# EasyEDA Pro project Zuko.epro, schematic Firebending
Assembly Variant: Basic; Board Name: Zuko V1; Create Date: 2026-10-25; Page Name: P1; Project Name: Zuko; Schematic Name: Firebending; Update Date: 2026-10-25; Company: 嘉立创EDA; Page Size: A4; Version: V1.0
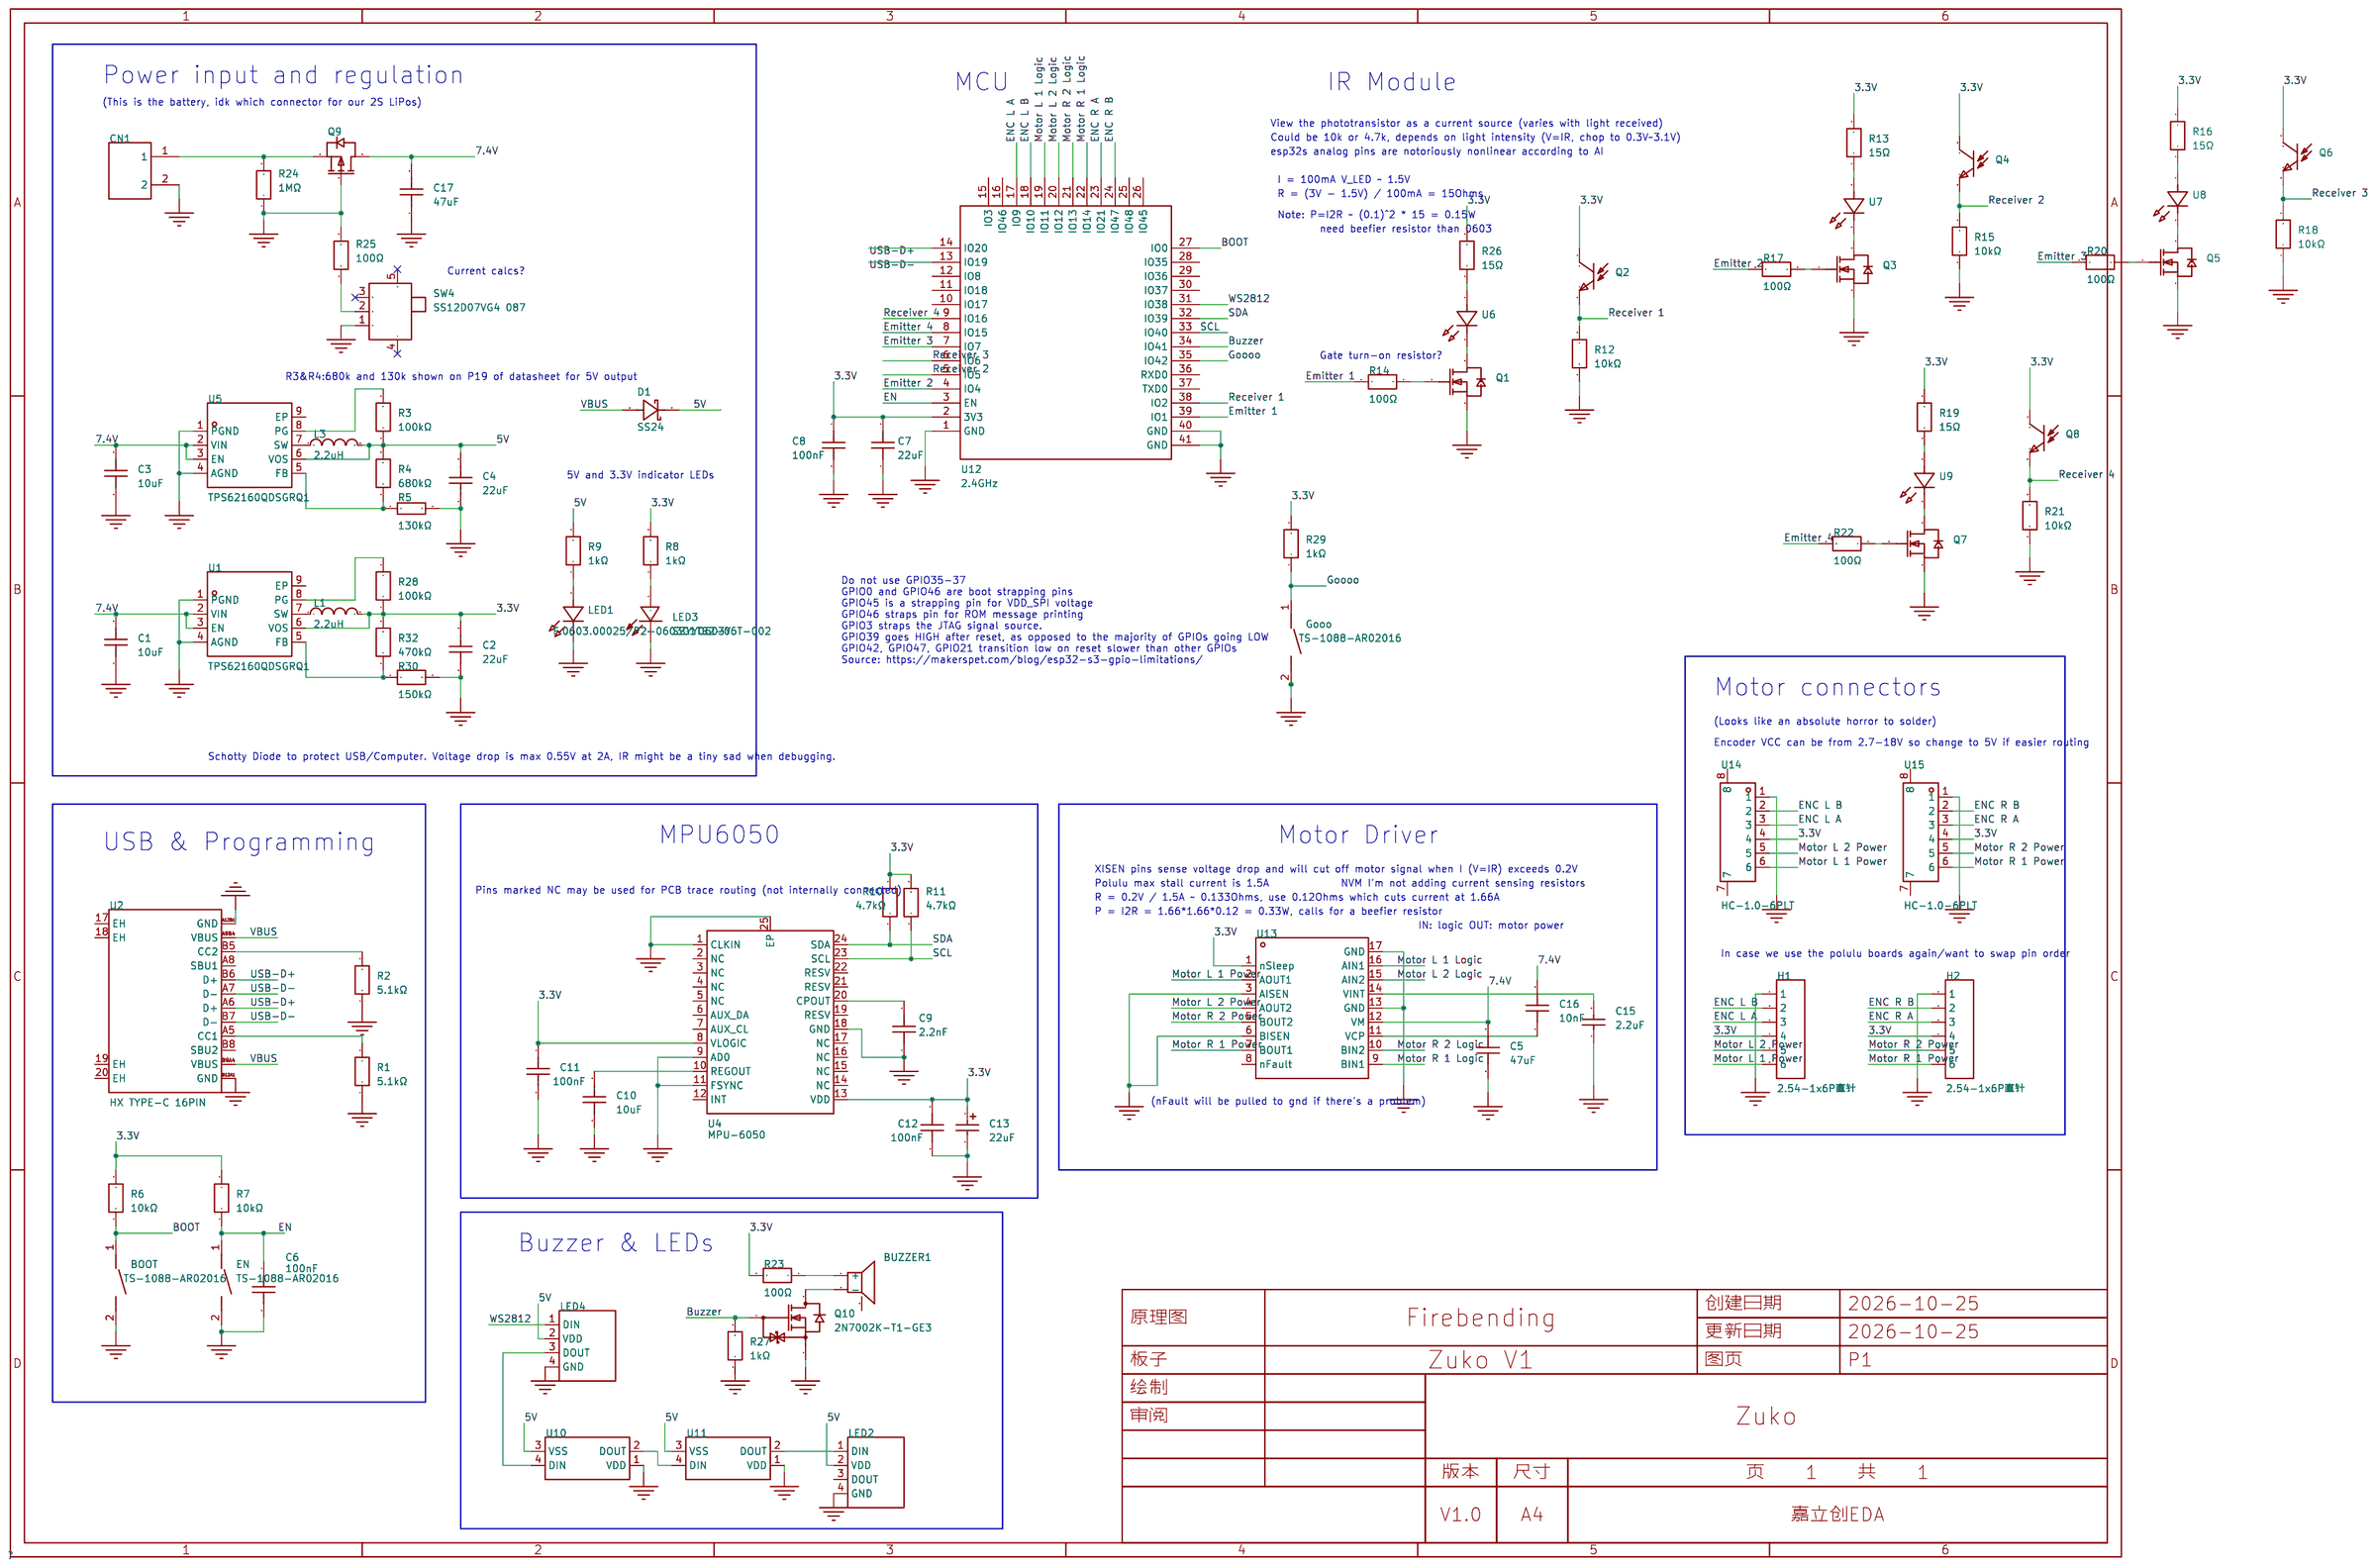
[diagram p0: schematic sheet]

## Parts
BOOT  TS-1088-AR02016  [SW-SMD_L3.9-W3.0-P4.45]
BUZZER1  4kHz  [BUZ-SMD_L5.0-W5.5-P4.60]
C1  10uF  [C0603]
C2  22uF  [C0603]
C3  10uF  [C0603]
C4  22uF  [C0603]
C5  47uF  [C1206]
C6  100nF  [C0603]
C7  22uF  [C0603]
C8  100nF  [C0603]
C9  2.2nF  [C0603]
C10  10uF  [C0603]
C11  100nF  [C0603]
C12  100nF  [C0603]
C13  22uF  [CASE-A_3216]
C15  2.2uF  [C0603]
C16  10nF  [C0603]
C17  47uF  [C1206]
CN1  B2B-PH-K-S(LF)(SN)  [CONN-TH_B2B-PH-K-S]
D1  SS24  [SMA_L4.3-W2.6-LS5.0-FD]
EN  TS-1088-AR02016  [SW-SMD_L3.9-W3.0-P4.45]
Gooo  TS-1088-AR02016  [SW-SMD_L3.9-W3.0-P4.45]
H1  2.54-1x6P直针  [HDR-TH_6P-P2.54-V-M-1]
H2  2.54-1x6P直针  [HDR-TH_6P-P2.54-V-M-1]
L1  2.2uH  [IND-SMD_L2.0-W1.6_WPN2016X]
L3  2.2uH  [IND-SMD_L2.0-W1.6_WPN2016X]
LED1  F.0603.00025/P2-0603G1TS2-06T-002  [LED0603-RD_GREEN]
LED2  WS2812C-4020-H2  [LED-SMD_4P-L4.0-W1.7_DCS-CA4020A0R02G02B02CE004]
LED3  SZYY0603Y  [LED0603-R-RD_YELLOW]
LED4  WS2812C-4020-H2  [LED-SMD_4P-L4.0-W1.7_DCS-CA4020A0R02G02B02CE004]
Q1  BS170FTA  [SOT-23-3_L2.9-W1.3-P1.90-LS2.4-BR]
Q2  TEFT4300  [SENSOR-TH_TEFT4300]
Q3  BS170FTA  [SOT-23-3_L2.9-W1.3-P1.90-LS2.4-BR]
Q4  TEFT4300  [SENSOR-TH_TEFT4300]
Q5  BS170FTA  [SOT-23-3_L2.9-W1.3-P1.90-LS2.4-BR]
Q6  TEFT4300  [SENSOR-TH_TEFT4300]
Q7  BS170FTA  [SOT-23-3_L2.9-W1.3-P1.90-LS2.4-BR]
Q8  TEFT4300  [SENSOR-TH_TEFT4300]
Q9  FQP27P06(UMW)  [TO-220-3_L10.0-W4.5-P2.54-L]
Q10  2N7002K-T1-GE3  [SOT-23-3_L2.9-W1.6-P1.90-LS2.8-BR]
R1  5.1kΩ  [R0603]
R2  5.1kΩ  [R0603]
R3  100kΩ  [R0603]
R4  680kΩ  [R0603]
R5  130kΩ  [R0603]
R6  10kΩ  [R0603]
R7  10kΩ  [R0603]
R8  1kΩ  [R0603]
R9  1kΩ  [R0603]
R10  4.7kΩ  [R0603]
R11  4.7kΩ  [R0603]
R12  10kΩ  [R0603]
R13  15Ω  [R0805]
R14  100Ω  [R0603]
R15  10kΩ  [R0603]
R16  15Ω  [R0805]
R17  100Ω  [R0603]
R18  10kΩ  [R0603]
R19  15Ω  [R0805]
R20  100Ω  [R0603]
R21  10kΩ  [R0603]
R22  100Ω  [R0603]
R23  100Ω  [R0603]
R24  1MΩ  [R0603]
R25  100Ω  [R0603]
R26  15Ω  [R0805]
R27  1kΩ  [R0603]
R28  100kΩ  [R0603]
R29  1kΩ  [R0603]
R30  150kΩ  [R0603]
R32  470kΩ  [R0603]
SW4  SS12D07VG4 087  [SW-TH_SS12D07VG4]
U1  TPS62160QDSGRQ1  [WSON-8_L2.0-W2.0-P0.50-TL-EP]
U2  HX TYPE-C 16PIN  [TYPE-C-SMD_HX-TYPE-C-16PIN]
U4  MPU-6050  [QFN-24_L4.0-W4.0-P0.50-BL-EP2.7]
U5  TPS62160QDSGRQ1  [WSON-8_L2.0-W2.0-P0.50-TL-EP]
U6  SFH 4545-DWEW  [LED-TH_BD5.6-P2.54-FD]
U7  SFH 4545-DWEW  [LED-TH_BD5.6-P2.54-FD]
U8  SFH 4545-DWEW  [LED-TH_BD5.6-P2.54-FD]
U9  SFH 4545-DWEW  [LED-TH_BD5.6-P2.54-FD]
U10  WS2812  [LED-SMD_4P-L5.0-W5.0-TL-A]
U11  WS2812  [LED-SMD_4P-L5.0-W5.0-TL-A]
U12  2.4GHz  [WIRELM-SMD_ESP32-S3-WROOM-1U]
U13  DRV8833PWPR  [TSSOP-16_L5.0-W4.4-P0.65-LS6.4-BL-EP]
U14  HC-1.0-6PLT  [CONN-SMD_6P-P1.00_HCTL_HC-1.0-6PLT]
U15  HC-1.0-6PLT  [CONN-SMD_6P-P1.00_HCTL_HC-1.0-6PLT]

## Library data of the parts
BOOT EN Gooo = TS-1088-AR02016: 电路结构:单刀单掷;按钮形状:圆形按钮;作用力:1.6N;安装方式:立贴;开关长度:3.9mm;开关宽度:3mm;开关高度:2mm;带支架:不带支架;触点电流:50mA;额定电压:12V;带灯:-;工作寿命:10万次;; LCSC Part Name: 3.9*3*2mm 立贴 轻触开关; Supplier Part: C720477; Manufacturer: XUNPU(讯普); Supplier Footprint: SMD,4x3mm; JLCPCB Part Class: Basic Part; Datasheet: https://item.szlcsc.com/datasheet/TS-1088-AR02016/763484.html; Supplier: LCSC; Circuit: 单刀单掷; Actuator Style: 圆形按钮; Operating Force: 1.6N; Mounting Type: 立贴; Length: 3.9mm; Width: 3mm; Switch Height: 2mm; with Bracket: 不带支架; Contact Current: 50mA; Voltage Rating: 12V; Actuator/Cap Color: 黑色; Termination Style: SMD接片; Life: 10万次; Operating Temperature: -30℃~+80℃
BUZZER1 = MLT-5020: 驱动方式:无源(外部驱动);构造类型:电磁式;额定电压:3V;频率:4kHz;声压(SPL):75dB;; LCSC Part Name: 无源(外部驱动) 电磁式 4kHz; Supplier Part: C94598; Manufacturer: 华能; Supplier Footprint: SMD,5x5mm; JLCPCB Part Class: Extended Part; Datasheet: https://item.szlcsc.com/datasheet/MLT-5020/95796.html; Supplier: LCSC; Driver Circuitry: 无源(外部驱动); Technology: 电磁式; Voltage Rating: 3V; Voltage - Supply: 2V~4V; Current Consumption: 100mA; Sound Pressure Level(SPL): 75dB; Length: 5.2mm; Width: 5.2mm; Height: 2.5mm; Operating Temperature: -20℃~+70℃
C1 C3 C10 = HGC0603R5106M160NTHJ: 容值:10uF;精度:±20%;额定电压:16V;温度系数:X5R;; LCSC Part Name: 10uF ±20% 16V; Supplier Part: C7472959; Manufacturer: Chinocera(华瓷); Supplier Footprint: 0603; JLCPCB Part Class: Extended Part; Datasheet: https://item.szlcsc.com/datasheet/HGC0603R5106M160NTHJ/8532806.html; Supplier: LCSC; Tolerance: ±20%; Voltage Rating: 16V; Temperature Coefficient: X5R
C2 C4 C7 = HGC0603R5226M100NTHJ: 容值:22uF;精度:±20%;额定电压:10V;温度系数:X5R;; LCSC Part Name: 22uF ±20% 10V; Supplier Part: C7432770; Manufacturer: Chinocera(华瓷); Supplier Footprint: 0603; JLCPCB Part Class: Extended Part; Datasheet: https://item.szlcsc.com/datasheet/HGC0603R5226M100NTHJ/8438252.html; Supplier: LCSC; Tolerance: ±20%; Voltage Rating: 10V; Temperature Coefficient: X5R
C5 C17 = HGC1206R5476M250NSPJ: 容值:47uF;精度:±20%;额定电压:25V;温度系数:X5R;; LCSC Part Name: 47uF ±20% 25V; Supplier Part: C22367835; Manufacturer: Chinocera(华瓷); Supplier Footprint: 1206; JLCPCB Part Class: Extended Part; Datasheet: https://item.szlcsc.com/datasheet/HGC1206R5476M250NSPJ/23841140.html; Supplier: LCSC; Tolerance: ±20%; Voltage Rating: 25V; Temperature Coefficient: X5R
C6 C8 C11 C12 = CL10B104KB8WPNC: 容值:100nF;精度:±10%;额定电压:50V;温度系数:X7R;; LCSC Part Name: 100nF ±10% 50V; Supplier Part: C307348; Manufacturer: SAMSUNG(三星); Supplier Footprint: 0603; JLCPCB Part Class: Extended Part; Datasheet: https://item.szlcsc.com/datasheet/CL10B104KB8WPNC/291022.html; Supplier: LCSC; Tolerance: ±10%; Voltage Rating: 50V; Temperature Coefficient: X7R
C9 = FCC0603B222K500CT: 容值:2.2nF;精度:±10%;额定电压:50V;温度系数:X7R;; LCSC Part Name: 2.2nF ±10% 50V; Supplier Part: C5137562; Manufacturer: FOJAN(富捷); Supplier Footprint: 0603; JLCPCB Part Class: Extended Part; Datasheet: https://item.szlcsc.com/datasheet/FCC0603B222K500CT/5747014.html; Supplier: LCSC; Tolerance: ±10%; Voltage Rating: 50V; Temperature Coefficient: X7R
C13 = TAJA226K010RNJ: 容值:22uF;精度:±10%;额定电压:10V;等效串联电阻(ESR):3Ω@100kHz;; LCSC Part Name: 22uF ±10% 10V; Supplier Part: C11366; Manufacturer: Kyocera AVX; Supplier Footprint: CASE-A-3216-18(mm); JLCPCB Part Class: Extended Part; Supplier: LCSC; Tolerance: ±10%; Voltage Rating: 10V; Equivalent Series Resistance(ESR): 3Ω@100kHz; Operating Temperature: -55℃~+125℃
C15 = CL10A225KO8NNNC: 容值:2.2uF;精度:±10%;额定电压:16V;温度系数:X5R;; LCSC Part Name: 2.2uF ±10% 16V; Supplier Part: C23630; Manufacturer: SAMSUNG(三星); Supplier Footprint: 0603; JLCPCB Part Class: Basic Part; Datasheet: https://item.szlcsc.com/datasheet/CL10A225KO8NNNC/24366.html; Supplier: LCSC; Tolerance: ±10%; Voltage Rating: 16V; Temperature Coefficient: X5R
C16 = FCC0603B103K500CT: 容值:10nF;精度:±10%;额定电压:50V;温度系数:X7R;; LCSC Part Name: 10nF ±10% 50V; Supplier Part: C5137477; Manufacturer: FOJAN(富捷); Supplier Footprint: 0603; JLCPCB Part Class: Extended Part; Datasheet: https://item.szlcsc.com/datasheet/FCC0603B103K500CT/5746979.html; Supplier: LCSC; Tolerance: ±10%; Voltage Rating: 50V; Temperature Coefficient: X7R
CN1 = B2B-PH-K-S(LF)(SN): 插针结构:1x2P;间距:2mm;安装方式:直插;参考系列:PH;总PIN数:2P;排数:1;每排PIN数:2;行距:-;额定电流:2A;触头材质:黄铜;触头镀层:锡;工作温度:-25℃~+85℃;; LCSC Part Name: 1x2P 间距:2mm 直插 系列:PH; Supplier Part: C131337; Manufacturer: JST; Supplier Footprint: 插件,P=2mm; JLCPCB Part Class: Extended Part; Datasheet: https://item.szlcsc.com/datasheet/B2B-PH-K-S(LF)(SN)/142630.html; Supplier: LCSC; Pins Structure: 1x2P; Pitch: 2mm; Mounting Type: 直插; Reference Series: PH; Number of Pins: 2P; Number of Rows: 1; Number of PINs Per Row: 2; Current Rating: 2A; Contact Material: 黄铜; Contact Plating: 锡; Operating Temperature: -25℃~+85℃; Voltage Rating: 100V; Plastic Material: PA66; Flame Retardant Rating: UL94V-0; Supplementary Features: 打K脚; Color: 白色; Z-Height of the Board: 6mm; X-Length of Bottom Edge on Board (Spacing Line): 5.9mm; Y-Width of Bottom Edge on Board: 4.5mm
D1 = SS24_C7420362: 二极管配置:独立式;正向压降(Vf):550mV@2A;直流反向耐压(Vr):40V;整流电流:2A;; LCSC Part Name: 电压:40V 电流:2A; Supplier Part: C7420362; Manufacturer: R+O(宏嘉诚); Supplier Footprint: SMA(DO-214AC); JLCPCB Part Class: Extended Part; Datasheet: https://item.szlcsc.com/datasheet/SS24/8397184.html; Supplier: LCSC; Diode Configuration: 独立式; Voltage - Forward(Vf@If): 550mV@2A; Voltage - DC Reverse(Vr): 40V; Current - Rectified: 2A; Reverse Leakage Current (Ir): 200uA@40V; Operating Junction Temperature Range: -55℃~+150℃; Non-Repetitive Peak Forward Surge Current: 50A
H1 H2 = 2.54-1x6P直针: 插针结构:1x6P;间距:2.54mm;行距:-;圆针/方针:方针;安装方式:直插;排数:单排;总PIN位数:6P;额定电流:3A;额定电压:-;配合针长度:6mm;塑高:2.5mm;端接针长度:3mm;触头材质:黄铜;触头镀层:金;工作温度:-40℃~+105℃;颜色:黑色;; LCSC Part Name: 1x6P 间距:2.54mm 方针 直插; Supplier Part: C37208; Manufacturer: BOOMELE(博穆精密); Supplier Footprint: 插件,P=2.54mm; JLCPCB Part Class: Extended Part; Datasheet: https://item.szlcsc.com/datasheet/2.54-1x6P%25E7%259B%25B4%25E9%2592%2588/38187.html; Supplier: LCSC; Pin Structure: 1x6P; Pitch: 2.54mm; Circluar Pins/Square Pins: 方针; Mounting Type: 直插; Number of Rows: 单排; Number of Pins: 6P; Current Rating: 3A; Length of Mating Pin: 6mm; Insulation Height: 2.5mm; Length of End Connection Pin: 3mm; Contact Material: 黄铜; Contact Plating: 金; Operating Temperature: -40℃~+105℃; Color: 黑色
L1 L3 = WPN201612H2R2MT: 电感值:2.2uH;精度:±20%;额定电流:1.8A;饱和电流(Isat):1.7A;类型:磁胶屏蔽电感;; LCSC Part Name: 2.2uH ±20% 1.7A; Supplier Part: C97025; Manufacturer: Sunlord(顺络); Supplier Footprint: 0806; JLCPCB Part Class: Extended Part; Datasheet: https://item.szlcsc.com/datasheet/WPN201612H2R2MT/98230.html; Supplier: LCSC; Tolerance: ±20%; Current Rating: 1.8A; Current - Saturation(Isat): 1.7A; DC Resistance(DCR): 146mΩ; Type: 磁胶屏蔽电感
LED1 = F.0603.00025/P2-0603G1TS2-06T-002: 灯头类型:1.6mmx0.8mm方形灯头;发光颜色:翠绿色;正向压降(Vf):2.6V~2.9V;功率:90mW;正向电流:30mA;波长:520nm~525nm;二极管配置:独立二极管;透镜颜色:-;色温:-;发光强度:230mcd;发光角度:120°;载带方式:-;工作温度:-40℃~+85℃;; LCSC Part Name: 0603翠绿; Supplier Part: C7496818; Manufacturer: TUOZHAN(拓展光电); Supplier Footprint: 0603; JLCPCB Part Class: Extended Part; Datasheet: https://item.szlcsc.com/datasheet/F.0603.00025%252FP2-0603G1TS2-06T-002/8563182.html; Supplier: LCSC; Lamp Holder Type: 1.6mmx0.8mm方形灯头; Illumination Color: 翠绿色; Voltage - Forward(Vf): 2.6V~2.9V; Power(Watts): 90mW; Forward Current: 30mA; Wavelength - Dominant: 520nm~525nm; Peak Wavelength: 517nm; Diode Configuration: 独立二极管; Luminous Intensity: 230mcd; Viewing Angle: 120°; Operating Temperature: -40℃~+85℃
LED2 LED4 = WS2812C-4020-H2: 5V 4020 RGB三色侧发光内置IC幻彩贴片灯珠，小电流，5mA，适用差异化产品，鼠标，键盘，音箱，机箱风扇，电子琴，乐器等; LCSC Part Name: 智能外控集成LED光源; Supplier Part: C42417604; Manufacturer: worldsemi; Supplier Footprint: SMD4020; JLCPCB Part Class: Extended Part; Datasheet: https://item.szlcsc.com/datasheet/WS2812C-4020-H2/44423164.html; Supplier: LCSC; Wavelength: G:525nm~530nm；B:467nm~472nm；R:622nm~626nm; Luminous Intensity: R:180mcd；G:500mcd；B:120mcd; Data Transmission Rate: 800Kbit/s; Voltage - Supply: 3.7V~5.3V; Quiescent Current: 0.6mA; Installation method: 正贴; Operating Temperature: -40℃~+65℃; Length: 4mm; Width: 2mm; Height: 1.65mm; Features: 内置上电复位电路；内置掉电复位电路
LED3 = SZYY0603Y: 灯头类型:-;发光颜色:黄色;正向压降(Vf):2.4V;功率:40mW;正向电流:10mA;波长:584nm~594nm;二极管配置:独立二极管;透镜颜色:无色透明透镜;色温:-;发光强度:175mcd;发光角度:120°;载带方式:-;工作温度:-40℃~+85℃;; LCSC Part Name: 黄灯; Supplier Part: C434424; Manufacturer: yongyu(永裕光电); Supplier Footprint: 0603; JLCPCB Part Class: Extended Part; Datasheet: https://item.szlcsc.com/datasheet/SZYY0603Y/431706.html; Supplier: LCSC; Illumination Color: 黄色; Voltage - Forward(Vf): 2.4V; Power(Watts): 40mW; Forward Current: 10mA; Wavelength - Dominant: 584nm~594nm; Peak Wavelength: 596nm; Diode Configuration: 独立二极管; Lens Color: 无色透明透镜; Luminous Intensity: 175mcd; Viewing Angle: 120°; Operating Temperature: -40℃~+85℃
Q1 Q3 Q5 Q7 = BS170FTA_C5236685: 漏源电压(Vdss):60V;连续漏极电流(Id):250mA;导通电阻(RDS(on)):2.8Ω@10V;耗散功率(Pd):300mW;阈值电压(Vgs(th)):2V@250uA;; LCSC Part Name: 耐压:60V 电流:250mA; Supplier Part: C5236685; Manufacturer: UMW(友台半导体); Supplier Footprint: SOT-23; JLCPCB Part Class: Extended Part; Datasheet: https://item.szlcsc.com/datasheet/BS170FTA/5939944.html; Supplier: LCSC; Drain to Source Voltage: 60V; Current - Continuous Drain(Id): 250mA; RDS(on): 2.8Ω@10V; Pd - Power Dissipation: 300mW; Gate Threshold Voltage (Vgs(th)): 2V@250uA; Gate Charge(Qg): 400pC@4.5V; Input Capacitance(Ciss): 25pF; Reverse Transfer Capacitance (Crss@Vds): 2pF; Operating Temperature: -55℃~+150℃; Output Capacitance(Coss): 5pF
Q2 Q4 Q6 Q8 = TEFT4300: 晶体管类型:NPN;集射极击穿电压(Vceo):70V;集电极电流(Ic):50mA;耗散功率(Pd):100mW;暗电流:1nA;峰值波长:925nm;; LCSC Part Name: 925nm的NPN光电三极管; Supplier Part: C118301; Manufacturer: VISHAY(威世); Supplier Footprint: 插件,D=3mm; JLCPCB Part Class: Extended Part; Datasheet: https://item.szlcsc.com/datasheet/TEFT4300/119566.html; Supplier: LCSC; type: NPN; Collector - Emitter Voltage VCEO: 70V; Current - Collector(Ic): 50mA; Dissipation Power(Max): 100mW; Current - Dark(Id): 1nA; Peak Wavelength: 925nm; Viewing Angle: ±30°; Operating Temperature: -40℃~+100℃; Vce Saturation(VCE(sat)): 0.3V@0.1mA
Q9 = FQP27P06(UMW): 漏源电压(Vdss):60V;连续漏极电流(Id):27A;导通电阻(RDS(on)):55mΩ@10V;耗散功率(Pd):120W;阈值电压(Vgs(th)):4V@250uA;; LCSC Part Name: P沟道 耐压:60V 电流:27A; Supplier Part: C7503194; Manufacturer: UMW(友台半导体); Supplier Footprint: TO-220; JLCPCB Part Class: Extended Part; Datasheet: https://item.szlcsc.com/datasheet/FQP27P06(UMW)/8592065.html; Supplier: LCSC; Drain to Source Voltage: 60V; Current - Continuous Drain(Id): 27A; RDS(on): 55mΩ@10V; Pd - Power Dissipation: 120W; Gate Threshold Voltage (Vgs(th)): 4V@250uA; Gate Charge(Qg): 43nC@48V; Input Capacitance(Ciss): 1.1nF; Reverse Transfer Capacitance (Crss@Vds): 120pF; Operating Temperature: -55℃~+175℃; Type: P沟道; Output Capacitance(Coss): 510pF
Q10 = 2N7002K-T1-GE3: 数量:1个N沟道;漏源电压(Vdss):60V;连续漏极电流(Id):300mA;导通电阻(RDS(on)):2Ω@10V;耗散功率(Pd):350mW;阈值电压(Vgs(th)):2.5V;; LCSC Part Name: 1个N沟道 耐压:60V 电流:300mA; Supplier Part: C81445; Manufacturer: VISHAY(威世); Supplier Footprint: SOT-23; JLCPCB Part Class: Extended Part; Datasheet: https://item.szlcsc.com/datasheet/2N7002K-T1-GE3/82596.html; Supplier: LCSC; Number: 1个N沟道; Drain to Source Voltage: 60V; Current - Continuous Drain(Id): 300mA; RDS(on): 2Ω@10V; Pd - Power Dissipation: 350mW; Gate Threshold Voltage (Vgs(th)): 2.5V; Gate Charge(Qg): 600pC@10V; Reverse Transfer Capacitance (Crss@Vds): 2.5pF; Operating Temperature: -55℃~+150℃
R1 R2 = FRC0603F5101TS: 电阻类型:厚膜电阻;阻值:5.1kΩ;精度:±1%;功率:100mW;工作电压:75V;温度系数:±100ppm/℃;; LCSC Part Name: 5.1kΩ ±1% 100mW 厚膜电阻; Supplier Part: C2907044; Manufacturer: FOJAN(富捷); Supplier Footprint: 0603; JLCPCB Part Class: Extended Part; Supplier: LCSC; Type: 厚膜电阻; Tolerance: ±1%; Power(Watts): 100mW; Voltage-Supply(Max): 75V; Temperature Coefficient: ±100ppm/℃; Operating Temperature: -55℃~+155℃
R3 R28 = FRC0603F1003TS: 电阻类型:厚膜电阻;阻值:100kΩ;精度:±1%;功率:100mW;工作电压:75V;温度系数:±100ppm/℃;; LCSC Part Name: 100kΩ ±1% 100mW 厚膜电阻; Supplier Part: C2906980; Manufacturer: FOJAN(富捷); Supplier Footprint: 0603; JLCPCB Part Class: Extended Part; Datasheet: https://item.szlcsc.com/datasheet/FRC0603F1003TS/3180493.html; Supplier: LCSC; Type: 厚膜电阻; Tolerance: ±1%; Power(Watts): 100mW; Voltage-Supply(Max): 75V; Temperature Coefficient: ±100ppm/℃; Operating Temperature: -55℃~+155℃
R4 = FRC0603F6803TS: 电阻类型:厚膜电阻;阻值:680kΩ;精度:±1%;功率:100mW;工作电压:75V;温度系数:±100ppm/℃;; LCSC Part Name: 680kΩ ±1% 100mW 厚膜电阻; Supplier Part: C2907061; Manufacturer: FOJAN(富捷); Supplier Footprint: 0603; JLCPCB Part Class: Extended Part; Supplier: LCSC; Type: 厚膜电阻; Tolerance: ±1%; Power(Watts): 100mW; Voltage-Supply(Max): 75V; Temperature Coefficient: ±100ppm/℃; Operating Temperature: -55℃~+155℃
R5 = 0603WAF1303T5E: 电阻类型:厚膜电阻;阻值:130kΩ;精度:±1%;功率:100mW;工作电压:75V;温度系数:±100ppm/℃;; LCSC Part Name: 130kΩ ±1% 100mW 厚膜电阻; Supplier Part: C22795; Manufacturer: UNI-ROYAL(厚声); Supplier Footprint: 0603; JLCPCB Part Class: Extended Part; Datasheet: https://item.szlcsc.com/datasheet/0603WAF1303T5E/23522.html; Supplier: LCSC; Type: 厚膜电阻; Tolerance: ±1%; Power(Watts): 100mW; Voltage-Supply(Max): 75V; Temperature Coefficient: ±100ppm/℃; Operating Temperature: -55℃~+155℃
R6 R7 R12 R15 R18 R21 = FRC0603F1002TS: 电阻类型:厚膜电阻;阻值:10kΩ;精度:±1%;功率:100mW;工作电压:75V;温度系数:±100ppm/℃;; LCSC Part Name: 10kΩ ±1% 100mW 厚膜电阻; Supplier Part: C2906982; Manufacturer: FOJAN(富捷); Supplier Footprint: 0603; JLCPCB Part Class: Extended Part; Datasheet: https://item.szlcsc.com/datasheet/FRC0603F1002TS/3180495.html; Supplier: LCSC; Type: 厚膜电阻; Tolerance: ±1%; Power(Watts): 100mW; Voltage-Supply(Max): 75V; Temperature Coefficient: ±100ppm/℃; Operating Temperature: -55℃~+155℃
R8 R9 R27 R29 = FRC0603F1001TS: 电阻类型:厚膜电阻;阻值:1kΩ;精度:±1%;功率:100mW;工作电压:75V;温度系数:±100ppm/℃;; LCSC Part Name: 1kΩ ±1% 100mW 厚膜电阻; Supplier Part: C2907002; Manufacturer: FOJAN(富捷); Supplier Footprint: 0603; JLCPCB Part Class: Extended Part; Datasheet: https://item.szlcsc.com/datasheet/FRC0603F1001TS/3180515.html; Supplier: LCSC; Type: 厚膜电阻; Tolerance: ±1%; Power(Watts): 100mW; Voltage-Supply(Max): 75V; Temperature Coefficient: ±100ppm/℃; Operating Temperature: -55℃~+155℃
R10 R11 = FRQ0603F4701TS: 电阻类型:厚膜电阻;阻值:4.7kΩ;精度:±1%;功率:100mW;工作电压:75V;温度系数:±100ppm/℃;; LCSC Part Name: 4.7kΩ ±1% 100mW 厚膜电阻; Supplier Part: C5713440; Manufacturer: FOJAN(富捷); Supplier Footprint: 0603; JLCPCB Part Class: Extended Part; Supplier: LCSC; Type: 厚膜电阻; Tolerance: ±1%; Power(Watts): 100mW; Voltage-Supply(Max): 75V; Temperature Coefficient: ±100ppm/℃; Operating Temperature: -55℃~+155℃
R13 R16 R19 R26 = ERJP06J150V: 电阻类型:厚膜电阻;阻值:15Ω;精度:±5%;功率:500mW;工作电压:400V;温度系数:±300ppm/℃;; LCSC Part Name: 15Ω ±5% 500mW 厚膜电阻; Supplier Part: C543433; Manufacturer: PANASONIC(松下); Supplier Footprint: 0805; JLCPCB Part Class: Extended Part; Datasheet: https://item.szlcsc.com/datasheet/ERJP06J150V/564069.html; Supplier: LCSC; Type: 厚膜电阻; Tolerance: ±5%; Power(Watts): 500mW; Voltage-Supply(Max): 400V; Temperature Coefficient: ±300ppm/℃; Operating Temperature: -55℃~+155℃
R14 R17 R20 R22 R23 R25 = FRC0603F1000TS: 电阻类型:厚膜电阻;阻值:100Ω;精度:±1%;功率:100mW;工作电压:75V;温度系数:±100ppm/℃;; LCSC Part Name: 100Ω ±1% 100mW 厚膜电阻; Supplier Part: C2906981; Manufacturer: FOJAN(富捷); Supplier Footprint: 0603; JLCPCB Part Class: Extended Part; Datasheet: https://item.szlcsc.com/datasheet/FRC0603F1000TS/3180494.html; Supplier: LCSC; Type: 厚膜电阻; Tolerance: ±1%; Power(Watts): 100mW; Voltage-Supply(Max): 75V; Temperature Coefficient: ±100ppm/℃; Operating Temperature: -55℃~+155℃
R24 = FRC0603F1004TS: 电阻类型:厚膜电阻;阻值:1MΩ;精度:±1%;功率:100mW;工作电压:75V;温度系数:±100ppm/℃;; LCSC Part Name: 1MΩ ±1% 100mW 厚膜电阻; Supplier Part: C2907003; Manufacturer: FOJAN(富捷); Supplier Footprint: 0603; JLCPCB Part Class: Extended Part; Datasheet: https://item.szlcsc.com/datasheet/FRC0603F1004TS/3180516.html; Supplier: LCSC; Type: 厚膜电阻; Tolerance: ±1%; Power(Watts): 100mW; Voltage-Supply(Max): 75V; Temperature Coefficient: ±100ppm/℃; Operating Temperature: -55℃~+155℃
R30 = FRC0603F1503TS: 电阻类型:厚膜电阻;阻值:150kΩ;精度:±1%;功率:100mW;工作电压:75V;温度系数:±100ppm/℃;; LCSC Part Name: 150kΩ ±1% 100mW 厚膜电阻; Supplier Part: C2906993; Manufacturer: FOJAN(富捷); Supplier Footprint: 0603; JLCPCB Part Class: Extended Part; Supplier: LCSC; Type: 厚膜电阻; Tolerance: ±1%; Power(Watts): 100mW; Voltage-Supply(Max): 75V; Temperature Coefficient: ±100ppm/℃; Operating Temperature: -55℃~+155℃
R32 = FRC0603F4703TS: 电阻类型:厚膜电阻;阻值:470kΩ;精度:±1%;功率:100mW;工作电压:75V;温度系数:±100ppm/℃;; LCSC Part Name: 470kΩ ±1% 100mW 厚膜电阻; Supplier Part: C2907040; Manufacturer: FOJAN(富捷); Supplier Footprint: 0603; JLCPCB Part Class: Extended Part; Datasheet: https://item.szlcsc.com/datasheet/FRC0603F4703TS/3180553.html; Supplier: LCSC; Type: 厚膜电阻; Tolerance: ±1%; Power(Watts): 100mW; Voltage-Supply(Max): 75V; Temperature Coefficient: ±100ppm/℃; Operating Temperature: -55℃~+155℃
SW4 = SS12D07VG4 087: 电路结构:单刀双掷;安装方式:直插;开关颜色:-;额定电流:500mA;额定电压:50V;工作寿命:5千次;; LCSC Part Name: SS12D07VG4; Supplier Part: C2939726; Manufacturer: SHOU HAN(首韩); Supplier Footprint: 插件,8.7x4.4mm; JLCPCB Part Class: Extended Part; Datasheet: https://item.szlcsc.com/datasheet/SS12D07VG4%2520087/3301205.html; Supplier: LCSC; Circuit: 单刀双掷; Termination Style: PC引脚; Length: 8.7mm; Width: 4.4mm; Switch Height: 4.7mm; Mounting Type: 直插; Current Rating: 500mA; Voltage Rating: 50V; Life: 5千次; Operating Temperature: -10℃~+50℃
U1 U5 = TPS62160QDSGRQ1: 功能类型:降压型;工作电压:3V~17V;输出电压:900mV~6V;输出电流:1A;输出类型:可调;; LCSC Part Name: 降压型 1A 3V~17V; Supplier Part: C2070770; Manufacturer: TI(德州仪器); Supplier Footprint: WSON-8-EP(2x2); JLCPCB Part Class: Extended Part; Datasheet: https://www.ti.com/cn/lit/ds/symlink/tps62160-q1.pdf; Supplier: LCSC; Function: 降压型; Voltage - Supply: 3V~17V; Output Voltage: 900mV~6V; Output Current: 1A; Frequency - Switching: 2.25MHz; Operating Temperature: -40℃~+125℃@(TJ); Synchronous Rectifier: 是; Number of Outputs: 1; Topology: 降压式; Quiescent Current: 17uA; Switch tube (built-in/external): 内置; Output Type: 可调; Features: 轻载高效模式；过流保护；工作状态指示
U2 = HX TYPE-C 16PIN: 连接器类型:Type-C;协议标准:USB 3.1;公母:母;安装方式:卧贴;触点数量:16P;端口数量:1;额定电流 - 电源:3A;工作温度:-30℃~+80℃;; LCSC Part Name: Type-C 母 卧贴; Supplier Part: C5178539; Manufacturer: hanxia(韩下); Supplier Footprint: SMD; JLCPCB Part Class: Extended Part; Datasheet: https://item.szlcsc.com/datasheet/HX%2520TYPE-C%252016PIN/5834061.html; Supplier: LCSC; Connector Type: Type-C; Protocol Standard: USB 3.1; Gender: 母; Mounting Type: 卧贴; Number of Contacts: 16P; Number of Ports: 1; Current Rating-Power: 3A; Voltage Rating: 20V; Connect-Disconnect Life: 1万次; Center Height: 1.68mm; Length: 7.35mm; Detection color: 黑色; Operating Temperature: -30℃~+80℃
U4 = MPU-6050: 传感器类型:IMU(加速度计+陀螺仪);接口类型:I2C;; Supplier Part: C24112; Manufacturer: TDK InvenSense(应美盛); Supplier Footprint: QFN-24-EP(4x4); JLCPCB Part Class: Extended Part; Datasheet: https://item.szlcsc.com/datasheet/MPU-6050/24852.html; Supplier: LCSC; Accelerometer Sensing Axis: X,Y,Z; Acceleration Measurement Range (MAX): ±16g; Gyroscope Sensing Axis: X,Y,Z; Gyroscope Measurement Range (MAX): ±2000dps; Sensor Type: IMU(加速度计+陀螺仪); Output Bits: 16bit; Interface: I2C; Voltage - Supply: 2.375V~3.46V; Cache Size: 1KB; Standby Current: 5uA; Operating Temperature: -40℃~+85℃; Features: 运动事件检测；同步与时间戳
U6-U9 = SFH 4545-DWEW: 正向压降(Vf):1.5V;波长:950nm;辐射强度:400mW/sr@IF=100mA;; LCSC Part Name: 光电二极管; Supplier Part: C2900372; Manufacturer: OSRAM(欧司朗); Supplier Footprint: 插件; JLCPCB Part Class: Extended Part; Datasheet: https://item.szlcsc.com/datasheet/SFH%25204545-DWEW/3148299.html; Supplier: LCSC; Voltage - Forward(Vf): 1.5V; Wavelength: 950nm; Radiant Intensity: 400mW/sr@IF=100mA; Operating Temperature: -40℃~+100℃
U10 U11 = WS2812: RGB三色灯珠，5050RGB集成光源内置IC幻彩灯珠单点单控5V，高性价比，12mA; Supplier Part: C42417498; Manufacturer: worldsemi; Supplier Footprint: SMD5050-4P; JLCPCB Part Class: Extended Part; Datasheet: https://item.szlcsc.com/datasheet/WS2812/44423158.html; Supplier: LCSC; Wavelength: R:623nm；B:451nm；G:523nm; Luminous Intensity: B:110mcd；R:320mcd；G:1000mcd; Data Transmission Rate: 800Kbit/s; Voltage - Supply: 3.7V~5.3V; Length: 5mm; Width: 5mm; Height: 1.57mm; Features: 内置上电复位电路；内置掉电复位电路
U12 = ESP32-S3-WROOM-1U-N16R8: 核心芯片:ESP32-S3R8;频率:2.4GHz;发射功率:20.5dBm;接收灵敏度:-103.5dBm;; LCSC Part Name: 不带固件 2.4GHz Wi-Fi (802.11b/g/n) + 蓝牙 5 (LE) 模组; Supplier Part: C3013946; Manufacturer: ESPRESSIF(乐鑫); Supplier Footprint: SMD,19.2x18mm; JLCPCB Part Class: Extended Part; Datasheet: https://item.szlcsc.com/datasheet/ESP32-S3-WROOM-1U-N16R8/3522416.html; Supplier: LCSC; Utilized IC / Part: ESP32-S3R8; Wireless Standard: Bluetooth5.0; Interface Type: I2C；GPIO；JTAG；UART；SPI；PWM；SDIO；ADC；USB；I2S; Output Power: 20.5dBm; Voltage - Supply: 3V~3.6V; Receive  Current: 95mA; Send  Current: 355mA; Sensitivity: -103.5dBm; Operating Temperature: -40℃~+65℃
U13 = DRV8833PWPR: DRV8833 具有电流调节功能的 10.8V、2A、双通道 H 桥电机驱动器; LCSC Part Name: 1.5A 有刷直流电机驱动芯片 10.8V; Supplier Part: C50506; Manufacturer: TI(德州仪器); Supplier Footprint: TSSOP-16-EP; JLCPCB Part Class: Extended Part; Datasheet: https://www.ti.com/cn/lit/gpn/drv8833; Supplier: LCSC; Motor Drive Voltage(Vm): 2.7V~10.8V; Output Current: 1.5A; Number of H-bridges: 2; Drive Type: 双极驱动; Technology: 是; RDS(on): 360mΩ; Operating Temperature: -40℃~+85℃; Features: 短路保护；过流保护；死区/直通保护；过温保护；欠压锁定
U14 U15 = HC-1.0-6PLT: 插针结构:1x6P;间距:1mm;安装方式:立贴;参考系列:SH;总PIN数:6P;排数:1;每排PIN数:6;行距:-;额定电流:1A;触头材质:磷青铜;触头镀层:锡;工作温度:-25℃~+85℃;; LCSC Part Name: 1x6P 间距:1mm 立贴 系列:SH; Supplier Part: C2845374; Manufacturer: HCTL(华灿天禄); Supplier Footprint: SMD,P=1mm; JLCPCB Part Class: Extended Part; Datasheet: https://item.szlcsc.com/datasheet/HC-1.0-6PLT/3039055.html; Supplier: LCSC; Pins Structure: 1x6P; Pitch: 1mm; Mounting Type: 立贴; Reference Series: SH; Number of Pins: 6P; Number of Rows: 1; Number of PINs Per Row: 6; Current Rating: 1A; Contact Material: 磷青铜; Contact Plating: 锡; Operating Temperature: -25℃~+85℃; Voltage Rating: 50V; Plastic Material: LCP; Flame Retardant Rating: UL94V-0; Supplementary Features: 辅助焊脚; Z-Height of the Board: 4.4mm; X-Length of Bottom Edge on Board (Spacing Line): 8.3mm; Y-Width of Bottom Edge on Board: 3.76mm

## Nets
3.3V: C2.2 C7.2 C8.1 C11.1 C12.1 C13.1 H1.4 H2.4 L1.2 Q2.1(C) Q4.1(C) Q6.1(C) Q8.1(C) R6.2 R7.2 R8.2 R10.2 R11.2 R13.2 R16.2 R19.2 R23.2 R26.2 R28.1 R29.2 R32.2 U1.6(VOS) U4.8(VLOGIC) U4.13(VDD) U12.2(3V3) U13.1(nSleep) U14.4 U15.4
5V: C4.2 D1.2(K) L3.2 LED2.2(VDD) LED4.2(VDD) R3.1 R4.2 R9.2 U5.6(VOS) U10.3(VSS) U11.3(VSS)
7.4V: C1.2 C3.2 C5.2 C16.2 C17.2 Q9.2(D) U1.2(VIN) U1.3(EN) U5.2(VIN) U5.3(EN) U13.12(VM)
GND: BOOT.2 C1.1 C2.1 C3.1 C4.1 C5.1 C6.2 C7.1 C8.2 C9.1 C10.1 C11.2 C12.2 C13.2 C15.1 C17.1 CN1.2 EN.2 Gooo.2 H1.1 H2.1 LED1.1(C) LED2.4(GND) LED3.2(-) LED4.4(GND) Q1.2(S) Q3.2(S) Q5.2(S) Q7.2(S) Q9.1(G) Q10.2(S) R1.1 R2.1 R5.2 R12.1 R15.1 R18.1 R21.1 R24.1 R25.2 R27.1 R30.2 SW4.1 U1.1(PGND) U1.4(AGND) U2.A12B1(GND) U2.B12A1(GND) U4.1(CLKIN) U4.9(AD0) U4.11(FSYNC) U4.18(GND) U4.25(EP) U5.1(PGND) U5.4(AGND) U10.1(VDD) U11.1(VDD) U12.1(GND) U12.40(GND) U12.41(GND) U13.3(AISEN) U13.6(BISEN) U13.13(GND) U13.17(GND) U14.1 U15.1
VBUS: D1.1(A) U2.A9B4(VBUS) U2.B9A4(VBUS)
BOOT: BOOT.1 R6.1 U12.27(IO0)
Buzzer: Q10.1(G) R27.2 U12.34(IO41)
Emitter 1: R14.2 U12.39(IO1)
Emitter 2: R17.2 U12.4(IO4)
Emitter 3: R20.2 U12.7(IO7)
Emitter 4: R22.2 U12.8(IO15)
EN: C6.1 EN.1 R7.1 U12.3(EN)
ENC L A: H1.3 U12.17(IO9) U14.3
ENC L B: H1.2 U12.18(IO10) U14.2
ENC R A: H2.3 U12.23(IO21) U15.3
ENC R B: H2.2 U12.24(IO47) U15.2
Goooo: Gooo.1 R29.1 U12.35(IO42)
Motor L 1 Logic: U12.19(IO11) U13.16(AIN1)
Motor L 1 Power: H1.6 U13.2(AOUT1) U14.6
Motor L 2 Logic: U12.20(IO12) U13.15(AIN2)
Motor L 2 Power: H1.5 U13.4(AOUT2) U14.5
Motor R 1 Logic: U12.22(IO14) U13.9(BIN1)
Motor R 1 Power: H2.6 U13.7(BOUT1) U15.6
Motor R 2 Logic: U12.21(IO13) U13.10(BIN2)
Motor R 2 Power: H2.5 U13.5(BOUT2) U15.5
Receiver 1: Q2.2(E) R12.2 U12.38(IO2)
Receiver 2: Q4.2(E) R15.2 U12.5(IO5)
Receiver 3: Q6.2(E) R18.2 U12.6(IO6)
Receiver 4: Q8.2(E) R21.2 U12.9(IO16)
SCL: R11.1 U4.23(SCL) U12.33(IO40)
SDA: R10.1 U4.24(SDA) U12.32(IO39)
USB-D+: U2.A6(D+) U2.B6(D+) U12.14(IO20)
USB-D-: U2.A7(D-) U2.B7(D-) U12.13(IO19)
WS2812: LED4.1(DIN) U12.31(IO38)
$1N20: R1.2 U2.A5(CC1)
$1N21: R2.2 U2.B5(CC2)
$1N44: R3.2 U5.8(PG)
$1N47: R4.1 R5.1 U5.5(FB)
$1N62: LED3.1(+) R8.1
$1N64: LED1.2(A) R9.1
$1N77: C9.2 U4.20(CPOUT)
$1N81: C10.2 U4.10(REGOUT)
$1N98: Q1.3(D) U6.2(C)
$1N100: R26.1 U6.1(A)
$1N101: Q1.1(G) R14.1
$1N103: R13.1 U7.1(A)
$1N105: Q3.3(D) U7.2(C)
$1N108: Q3.1(G) R17.1
$1N112: R16.1 U8.1(A)
$1N114: Q5.3(D) U8.2(C)
$1N117: Q5.1(G) R20.1
$1N121: R19.1 U9.1(A)
$1N123: Q7.3(D) U9.2(C)
$1N126: Q7.1(G) R22.1
$1N133: U10.2(DOUT) U11.4(DIN)
$1N138: LED4.3(DOUT) U10.4(DIN)
$1N141: LED2.1(DIN) U11.2(DOUT)
$1N147: CN1.1 Q9.3(S) R24.2
$1N151: R25.1 SW4.2
$1N168: C16.1 U13.11(VCP)
$1N176: C15.2 U13.14(VINT)
$1N274: BUZZER1.2(-) Q10.3(D)
$1N275: BUZZER1.1(+) R23.1
$1N290: R30.1 R32.1 U1.5(FB)
$1N291: R28.2 U1.8(PG)
$1N298: L1.1 U1.7(SW)
$1N299: L3.1 U5.7(SW)

Not connected (* = marked no-connect by the designer): BUZZER1 3(NC); LED2 3(DOUT); SW4 3* 4* 5*; U1 9(EP); U2 17(EH) 18(EH) 19(EH) 20(EH) A8(SBU1) B8(SBU2); U4 2(NC) 3(NC) 4(NC) 5(NC) 6(AUX_DA) 7(AUX_CL) 12(INT) 14(NC) 15(NC) 16(NC) 17(NC) 19(RESV) 21(RESV) 22(RESV); U5 9(EP); U12 10(IO17) 11(IO18) 12(IO8) 15(IO3) 16(IO46) 25(IO48) 26(IO45) 28(IO35) 29(IO36) 30(IO37) 36(RXD0) 37(TXD0); U13 8(nFault); U14 7 8; U15 7 8

## Notes on the sheet
- Power input and regulation
- MCU
- IR Module
- (This is the battery, idk which connector for our 2S LiPos)
- View the phototransistor as a current source (varies with light received)
- Could be 10k or 4.7k, depends on light intensity (V=IR, chop to 0.3V~3.1V)
- esp32s analog pins are notoriously nonlinear according to AI
- I = 100mA V_LED ~ 1.5V
- R = (3V - 1.5V) / 100mA = 15Ohms
- Note: P=I2R ~ (0.1)^2 * 15 = 0.15W
- need beefier resistor than 0603
- Current calcs?
- Gate turn-on resistor?
- R3&R4:680k and 130k shown on P19 of datasheet for 5V output
- 5V and 3.3V indicator LEDs
- Do not use GPIO35-37
  GPIO0 and GPIO46 are boot strapping pins
  GPIO45 is a strapping pin for VDD_SPI voltage
  GPIO46 straps pin for ROM message printing
  GPIO3 straps the JTAG signal source.
  GPIO39 goes HIGH after reset, as opposed to the majority of GPIOs going LOW
  GPIO42, GPIO47, GPIO21 transition low on reset slower than other GPIOs
  Source: https://makerspet.com/blog/esp32-s3-gpio-limitations/
- Motor connectors
- (Looks like an absolute horror to solder)
- Encoder VCC can be from 2.7-18V so change to 5V if easier routing
- Schotty Diode to protect USB/Computer. Voltage drop is max 0.55V at 2A, IR might be a tiny sad when debugging.
- MPU6050
- Motor Driver
- USB & Programming
- XISEN pins sense voltage drop and will cut off motor signal when I (V=IR) exceeds 0.2V
- Pins marked NC may be used for PCB trace routing (not internally connected)
- Polulu max stall current is 1.5A
- NVM I'm not adding current sensing resistors
- R = 0.2V / 1.5A ~ 0.133Ohms, use 0.12Ohms which cuts current at 1.66A
- P = I2R = 1.66*1.66*0.12 = 0.33W, calls for a beefier resistor
- IN: logic OUT: motor power
- In case we use the polulu boards again/want to swap pin order
- (nFault will be pulled to gnd if there's a problem)
- Buzzer & LEDs
